# Altium schematic sheet EntranceSheet.SchDoc
size Letter; DocumentNumber: 0; SheetNumber: 0
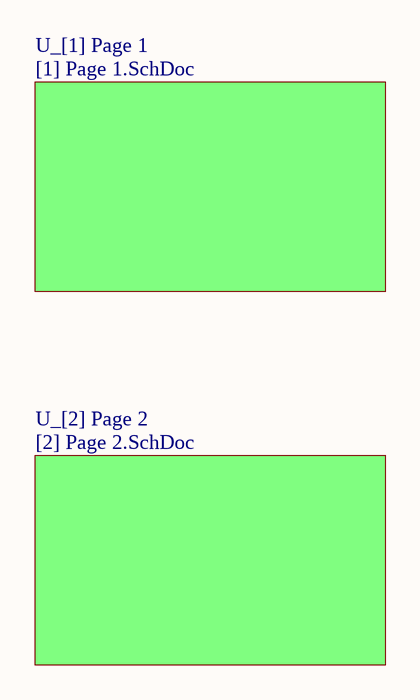
[diagram p0: EntranceSheet.SchDoc]

## Sub-sheets
U_[1] Page 1 = [1] Page 1.SchDoc: no entries
U_[2] Page 2 = [2] Page 2.SchDoc: no entries